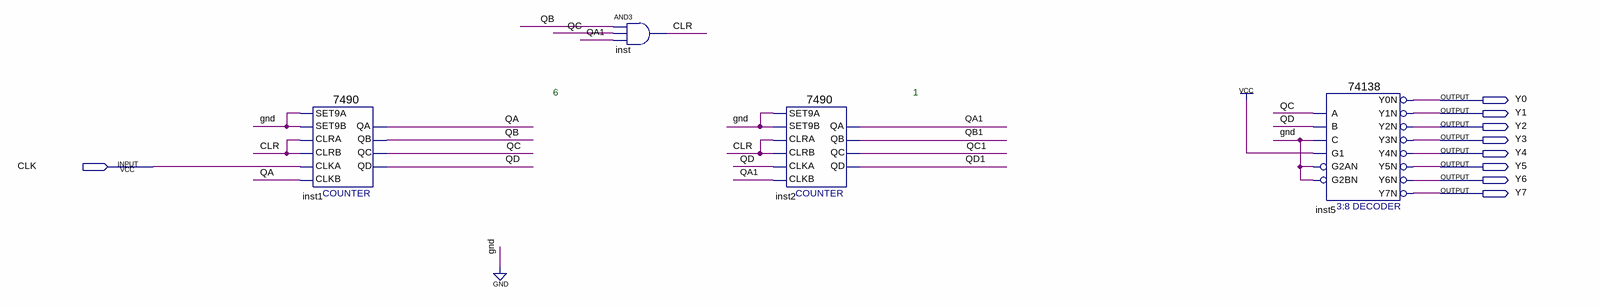
[diagram p0: schematic sheet]
// Quartus schematic FPGA_Mod16_Scanner.bdf as structural Verilog: 4 symbols, 9 pins
module FPGA_Mod16_Scanner (
  input  CLK,
  output Y0,
  output Y1,
  output Y2,
  output Y3,
  output Y4,
  output Y5,
  output Y6,
  output Y7
);

  wire CLR, QA, QA1, QB, QB1, QC, QC1, QD, QD1;

  \7490  inst1 (
    .SET9A(1'b0), .CLRA(CLR), .SET9B(1'b0), .CLKB(QA), .CLKA(CLK), .CLRB(CLR), .QD(QD), .QA(QA), .QB(QB),
    .QC(QC));
  and inst (CLR, QB, QC, QA1);
  \7490  inst2 (
    .SET9A(1'b0), .CLRA(CLR), .SET9B(1'b0), .CLKB(QA1), .CLKA(QD), .CLRB(CLR), .QD(QD1), .QA(QA1), .QB(QB1),
    .QC(QC1));
  \74138  inst5 (
    .A(QC), .B(QD), .G1(1'b1), .C(1'b0), .G2AN(1'b0), .G2BN(1'b0), .Y0N(Y0), .Y1N(Y1), .Y2N(Y2), .Y3N(Y3),
    .Y4N(Y4), .Y5N(Y5), .Y6N(Y6), .Y7N(Y7));

  // Notes on the sheet:
  //   6
  //   1
endmodule
